# Altium schematic sheet Load3.SchDoc
size A4; SheetNumber: 6; SheetTotal: 15
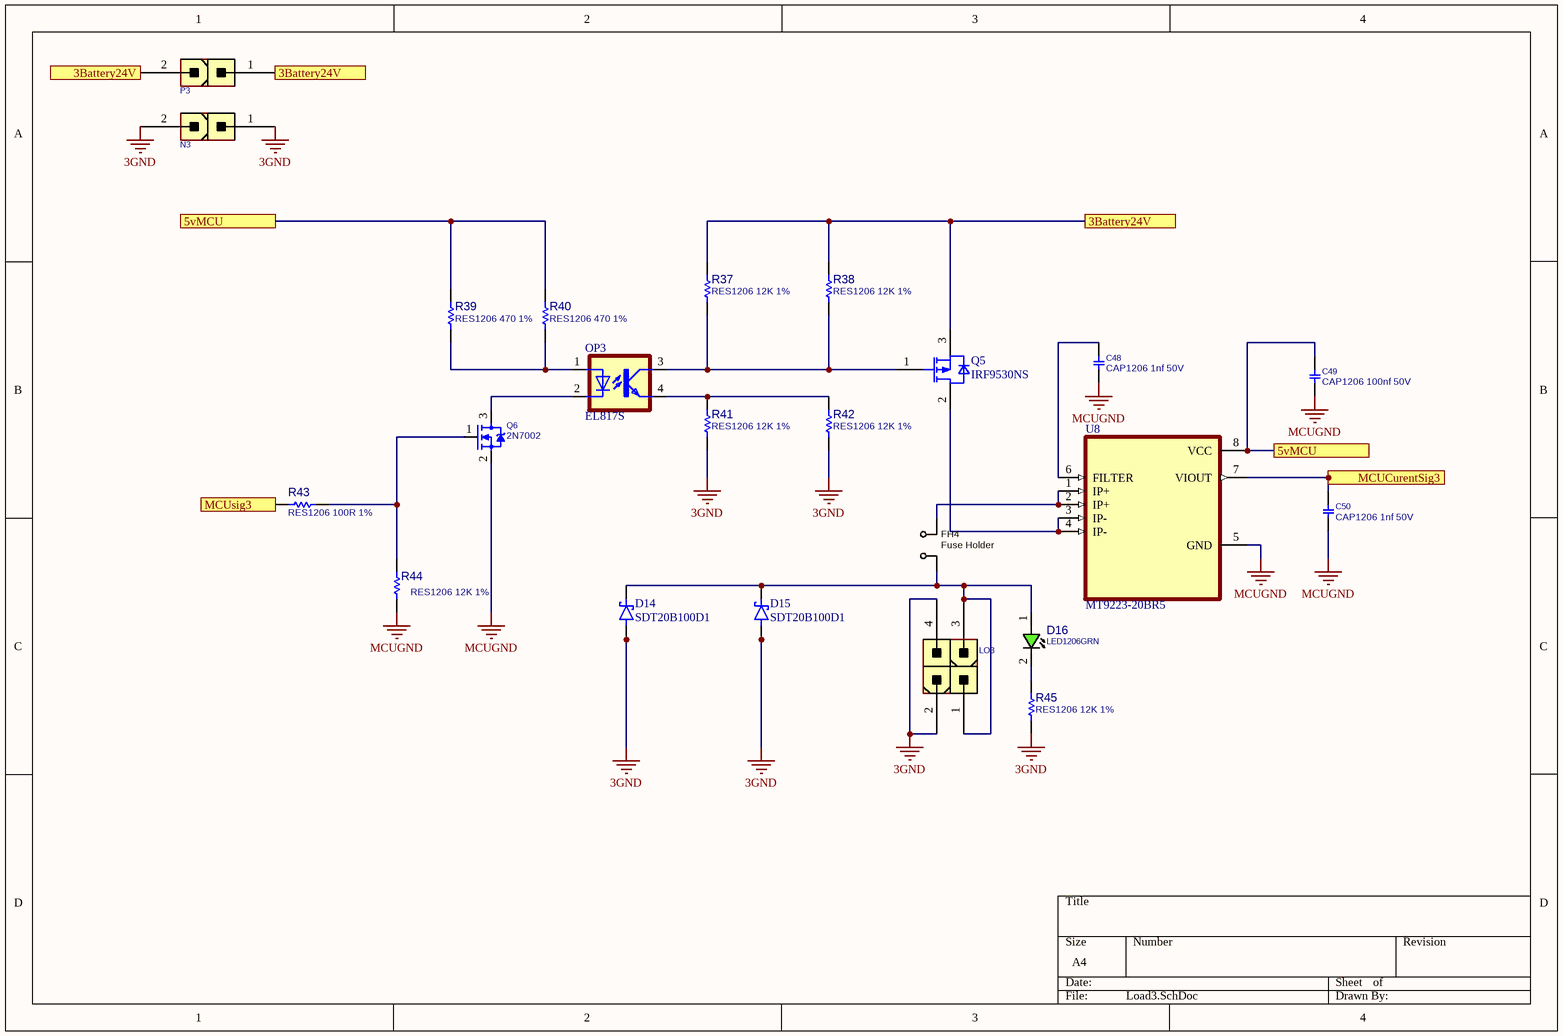
[diagram p0: Load3.SchDoc]

## Parts
C48  CAP1206 1nf 50V  [C1206]
C49  CAP1206 100nf 50V  [C1206]
C50  CAP1206 1nf 50V  [C1206]
D14  SDT20B100D1  [DPAK229P990X238-3N]
D15  SDT20B100D1  [DPAK229P990X238-3N]
D16  LED1206GRN  [LED1206GRN]
FH4  Fuse Holder  [FH_24101812]
LO3  CONN_ATXPWR_4  [ATXPWR_4]  (value not drawn)
N3  CONN_ATXPWR_2  [ATXPWR_2]  (value not drawn)
OP3  EL817S  [SOIC254P1030X460-4N]
P3  CONN_ATXPWR_2  [ATXPWR_2]  (value not drawn)
Q5  IRF9530NS  [TO254P1528X508-4_3N-V1]
Q6  2N7002  [SOT23_3]
R37  RES1206 12K 1%  [R1206]
R38  RES1206 12K 1%  [R1206]
R39  RES1206 470 1%  [R1206]
R40  RES1206 470 1%  [R1206]
R41  RES1206 12K 1%  [R1206]
R42  RES1206 12K 1%  [R1206]
R43  RES1206 100R 1%  [R1206]
R44  RES1206 12K 1%  [R1206]
R45  RES1206 12K 1%  [R1206]
U8  MT9223-20BR5  [SOIC127P600X175-8N]

## Ports
3Battery24V, 5vMCU, MCUCurentSig3, MCUsig3

## Nets
3GND: D14.1(A) D14.3(A__1) D15.1(A) D15.3(A__1) LO3.2 LO3.4 N3.1 N3.2 R41.2 R42.2 R45.2
MCUGND: C48.2 C49.2 C50.2 Q6.2(SOURCE) R44.2 U8.5(GND)
3Battery24V: P3.1 P3.2 Q5.3(SOURCE) R37.1 R38.1 ; port 3Battery24V
5vMCU: C49.1 R39.2 R40.2 U8.8(VCC) ; port 5vMCU
MCUCurentSig3: C50.1 U8.7(VIOUT) ; port MCUCurentSig3
MCUsig3: R43.1 ; port MCUsig3
NetC48_1: C48.1 U8.6(FILTER)
NetD14_4: D14.4(K) D15.4(K) D16.1(ANODE) FH4.1 LO3.1 LO3.3
NetD16_2: D16.2(CATHODE) R45.1
NetFH4_2: FH4.2 U8.1(IP+) U8.2(IP+)
NetOP3_1: OP3.1(A) R39.1 R40.1
NetOP3_2: OP3.2(C) Q6.3(DRAIN)
NetOP3_3: OP3.3(COL) Q5.1(GATE) R37.2 R38.2
NetOP3_4: OP3.4(EMIT) R41.1 R42.1
NetQ5_2: Q5.2(DRAIN) U8.3(IP-) U8.4(IP-)
NetQ6_1: Q6.1(GATE) R43.2 R44.1

## Library data of the parts
C48-C50 = CAP_SMD_MLCC_1206: CAP, MLCC; PARAM: -, -%; MANF_P#: MANF_PART#; PARAM2: -V; PRICE: 100= 1$; MANF: -; ASSEMBLY: ASSEMBLY
D14 D15 = MBRD835L: Diode Schottky 35 V 8A Surface Mount DPAK; MF: ON Semiconductor; SnapEDA_Link: https://www.snapeda.com/parts/MBRD835L/Onsemi/view-part/?ref=snap; Package: TO-252-3 MICROSS/On Semiconductor; Value: *; MP: MBRD835L; Check_prices: https://www.snapeda.com/parts/MBRD835L/Onsemi/view-part/?ref=eda
D16 = LED_SMD_1206_GRN: LED, SMD, 1206, GREEN; PARAM: 20mA; DESC: DESCRIPTION; PARAM2: 2.2V; MANF: -; ASSEMBLY: ASSEMBLY; PRICE: 36t@Javan; MANF_P#: -; VALUE: LED1206GRN; MountType: SMT; PartType: LED
FH4 = FUSE_SMD_HOLDER_24101812: Fuse SMD2410 Holder; PARAM: max. 10A; MANF: Littelfuse; MANF_P#: 01550900M; PARAM2: 125v; PRICE: 0.2$; PACKAGE: SMD,5.0x9.7mm; VALUE: Fuse Holder
LO3 = CONN_ATXPWR_4: CONN, ATX POWER, 4 P; MANF: TE, Molex; MANF_P#: 4-1775099-0, 39281043; VALUE: CONN_ATXPWR_4; MountType: THD; PACKAGE: ATXPWR-4pin; Part Type: Conn.
N3 P3 = CONN_ATXPWR_2: CONN, ATX POWER, 2 P; MANF: Molex; MANF_P#: 39281023; VALUE: CONN_ATXPWR_2; MountType: THD; PACKAGE: ATXPWR-2pin; Part Type: Conn.
OP3 = EL817S: Optoisolator Transistor Output 5000Vrms 1 Channel 4-SMD; MF: Everlight Electronics; SnapEDA_Link: https://www.snapeda.com/parts/EL817S/Everlight+Electronics+Co+Ltd/view-part/?ref=snap; Package: SMD-4 Everlight Electronics Co Ltd; Value: *; MP: EL817S; Check_prices: https://www.snapeda.com/parts/EL817S/Everlight+Electronics+Co+Ltd/view-part/?ref=eda
Q5 = IRF9530NS: OptiMOS - P2 Power-Transistor, P-channel-Enhancement mode, VDS -30V; Manufacturer: Infineon Technologies; Manufacturer Order NumberManufacturer Order Number: IRF9530NS; PackageReference: PG-TO263-3-901
Q6 = MOSN_2N7002_SOT23: MOSFET, N-CH, 60V, 0.3A; MANF: NXP; ASSEMBLY: ASSEMBLY; MANF_P#: 2N7002; PARAM2: 60v; PARAM: 0.3A; PRICE: 0.3t@Javan; VALUE: 2N7002
R37-R45 = RES_SMD_1206: RESISTOR, SMD; PARAM: 1%, 0.25W; DESC: DESCRIPTION; DIST#: MOUSER; MANF_P#: -; MANF: -; ASSEMBLY: ASSEMBLY; PRICE: -; PARAM2: -
U8 = ACS712ELCTR-05B-T: MF: {'manufacturer': u'Allegro MicroSystems'}; Package: None; Price: None; Value: *; MP: ACS712ELCTR-05B-T; Availability: Unavailable